# Altium schematic sheet schematic_of_servo_power_distribution.SchDoc
size A4; SheetNumber: 2; SheetTotal: 2
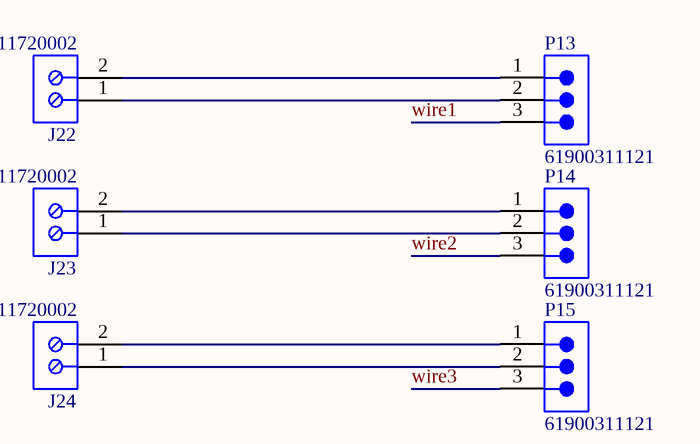
[diagram p0: schematic_of_servo_power_distribution.SchDoc]

## Parts
J22  691211720002  [691211720002]
J23  691211720002  [691211720002]
J24  691211720002  [691211720002]
P13  61900311121  [61900311121]
P14  61900311121  [61900311121]
P15  61900311121  [61900311121]

## Nets
wire1: P13.3
wire2: P14.3
wire3: P15.3
NetJ22_1: J22.1 P13.2
NetJ22_2: J22.2 P13.1
NetJ23_1: J23.1 P14.2
NetJ23_2: J23.2 P14.1
NetJ24_1: J24.1 P15.2
NetJ24_2: J24.2 P15.1

## Library data of the parts
J22-J24 = CMP-1502-02524-3: 211 Series 5MM Pitch Straight, Pcb Terminal Block, Through Hole, 2 Way; Number of Levels: 1; Current: 10A; Voltage: 300V; Pitch: 5.0038mm; Wire Gauge (Min): 12AWG; Connector Type: PCB, Terminal Block; Number of Positions Per Level: 2; Plating: Brass, Steel; Wire Gauge (Max): 24AWG; Stripping Length: -7mm; Termination: Screw; Height: 15.5mm; Contact Plating: Tin; REACH SVHC: Unknown; Contact Material: Brass; Width: 10mm; RoHS: Compliant; Number of Pins: 2; Lead Pitch: 5mm; Mount: Through Hole; Min Operating Temperature: -40°C; Length: 13.7mm; Number of Contacts: 2; Color: Green; Wire/Cable Gauge: 12AWG; Housing Material: Nylon; Packaging: Box; Max Operating Temperature: 105°C
P13-P15 = CMP-1502-00585-3: Wr-wtb Series, 2.54MM Pitch 3 Way 1 Row Straight Pcb Header, Through Hole; Number of Contacts: 3; Contact Resistance: 20mΩ; Gender: Male; Connector Type: Male Pin; Voltage Rating: 250V; Insulation Resistance: 1GΩ; Current Rating: 3A; Width: 7.66mm; Mount: Through Hole; Pitch: 2.54mm; Housing Material: Nylon; Contact Mating Length: 7.493mm; Flammability Rating: UL94 V-0; Fastening Type: Friction; Height: 12.5mm; Number of Rows: 1; Orientation: Vertical; Packaging: Bulk; Contact Material: Copper; Max Operating Temperature: 105°C; Contact Plating: Tin; Operating Supply Voltage: 250V; Termination: Through Hole; Number of Pins: 3; Min Operating Temperature: -40°C; Contact Gender: Male; Color: Beige; RoHS: Compliant; Lead Pitch: 2.54mm; Length: 7.62mm; Number of Positions: 3